# EasyEDA Pro project adc_frontend.epro

# Schematic Schematic1
Assembly Variant: Basic; Board Name: Board1; Create Date: 2026-09-28; Page Name: P1; Project Name: ADC; Schematic Name: Schematic1; Update Date: 2026-09-28; Company: 嘉立创EDA; Page Size: A4; Version: V1.0
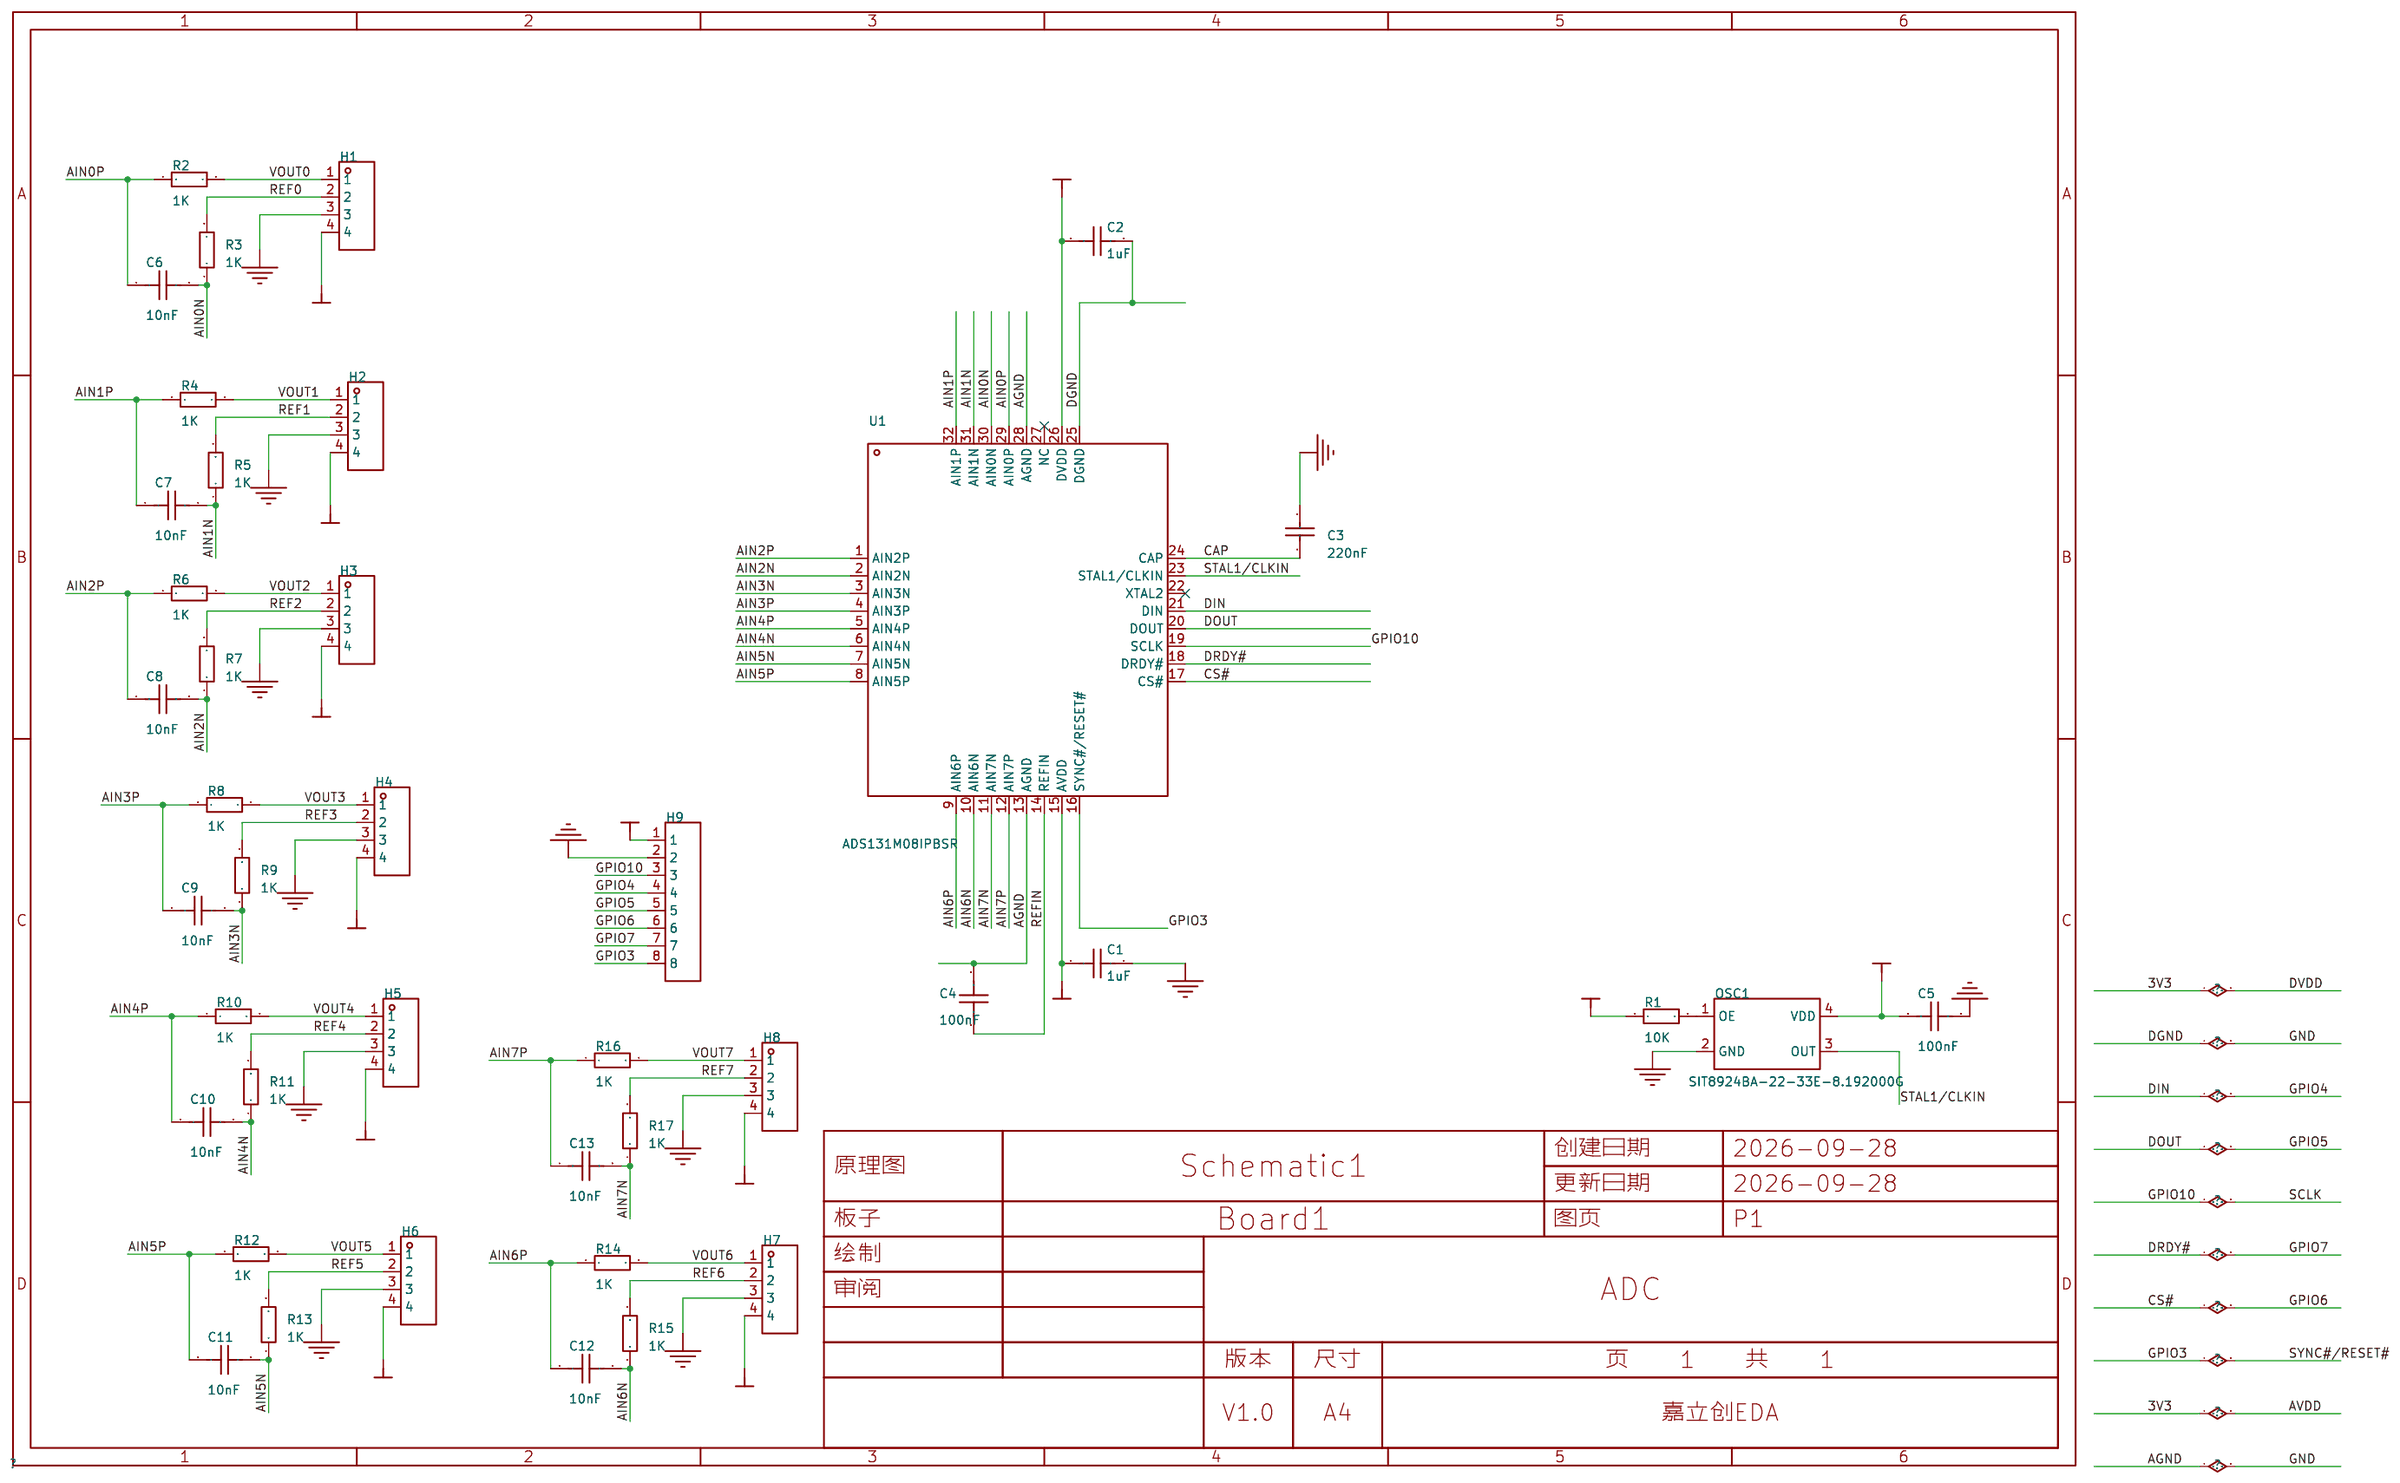
[diagram p0: schematic sheet]

## Parts
C1  1uF  [C0603]
C2  1uF  [C0603]
C3  220nF  [C0603]
C4  100nF  [C0603]
C5  100nF  [C0603]
C6  10nF  [C0603]
C7  10nF  [C0603]
C8  10nF  [C0603]
C9  10nF  [C0603]
C10  10nF  [C0603]
C11  10nF  [C0603]
C12  10nF  [C0603]
C13  10nF  [C0603]
H1  -  [HDR-TH_4P-P2.54-V-F]
H2  -  [HDR-TH_4P-P2.54-V-F]
H3  -  [HDR-TH_4P-P2.54-V-F]
H4  -  [HDR-TH_4P-P2.54-V-F]
H5  -  [HDR-TH_4P-P2.54-V-F]
H6  -  [HDR-TH_4P-P2.54-V-F]
H7  -  [HDR-TH_4P-P2.54-V-F]
H8  -  [HDR-TH_4P-P2.54-V-F]
H9  -  [HDR-TH_8P-P2.54-V-F-1]
OSC1  SIT8924BA-22-33E-8.192000G  [OSC-SMD_4P-L3.2-W2.5-BL-2]
R1  10K  [R0603]
R2  1K  [R0603]
R3  1K  [R0603]
R4  1K  [R0603]
R5  1K  [R0603]
R6  1K  [R0603]
R7  1K  [R0603]
R8  1K  [R0603]
R9  1K  [R0603]
R10  1K  [R0603]
R11  1K  [R0603]
R12  1K  [R0603]
R13  1K  [R0603]
R14  1K  [R0603]
R15  1K  [R0603]
R16  1K  [R0603]
R17  1K  [R0603]
U1  ADS131M08IPBSR  [TQFP-32_L5.0-W5.0-P0.50-LS7.0-TL]

## Library data of the parts
C1 C2 = CC0603KRX7R8BB105: 容值:1uF;精度:±10%;额定电压:25V;温度系数:X7R;; LCSC Part Name: 1uF ±10% 25V; Supplier Part: C106858; Manufacturer: YAGEO(国巨); Supplier Footprint: 0603; JLCPCB Part Class: Extended Part; Datasheet: https://item.szlcsc.com/datasheet/CC0603KRX7R8BB105/108074.html; Supplier: LCSC; Tolerance: ±10%; Voltage Rating: 25V; Temperature Coefficient: X7R
C3 = CL10B224KA8NNNC: 容值:220nF;精度:±10%;额定电压:25V;温度系数:X7R;; LCSC Part Name: 220nF ±10% 25V; Supplier Part: C21120; Manufacturer: SAMSUNG(三星); Supplier Footprint: 0603; JLCPCB Part Class: Basic Part; Datasheet: https://item.szlcsc.com/datasheet/CL10B224KA8NNNC/21832.html; Supplier: LCSC; Tolerance: ±10%; Voltage Rating: 25V; Temperature Coefficient: X7R
C4 C5 = FCC0603B104K500CT: 容值:100nF;精度:±10%;额定电压:50V;温度系数:X7R;; LCSC Part Name: 100nF ±10% 50V; Supplier Part: C5137636; Manufacturer: FOJAN(富捷); Supplier Footprint: 0603; JLCPCB Part Class: 扩展库; Datasheet: https://item.szlcsc.com/datasheet/FCC0603B104K500CT/5747088.html; Supplier: LCSC; Tolerance: ±10%; Voltage Rating: 50V; Temperature Coefficient: X7R
C6-C13 = CAP_0603: Supplier Footprint: 0603
H1-H8 = HDR-F_2.54_1x4P: Supplier Part: C2718488; Supplier Footprint: 插件
H9 = HDR-F_2.54_1x8P: Supplier Part: C27438; Supplier Footprint: 插件
OSC1 = SIT8924BA-22-33E-8.192000G: Supplier Part: C7496633; Manufacturer: SITIME; Supplier Footprint: SMD3225-4P; JLCPCB Part Class: Extended Part; Supplier: LCSC
R1-R17 = Res_0603: Supplier Footprint: 0603
U1 = ADS131M08IPBSR: 分辨率(位):24;采样率:32kHz;工作电压:2.7V~3.6V;接口类型:SPI;; LCSC Part Name: 8通道、同步采样、24位△-∑ ADC; Supplier Part: C2862610; Manufacturer: TI(德州仪器); Supplier Footprint: TQFP-32(5x5); JLCPCB Part Class: Extended Part; Datasheet: https://www.ti.com/cn/lit/ds/symlink/ads131m08.pdf; Supplier: LCSC; Resolution (Bits): 24; Sampling Rate: 32kHz; number of channels: 8; Voltage - Supply: 2.7V~3.6V; Interface: SPI; differential input: 是; Integral non - linearity: 7.5LSB; Operating Temperature: -40℃~+125℃; Signal-to-Noise Ratio: 101dB; Clock/Oscillator: 外置; Clock Frequency: 8.192MHz; Voltage Reference: 内置; Programmable Gain: 支持; ADC architecture: Sigma-Delta; Quiescent Current (Iq): 350nA; Features: 多芯片同步；同步触发；内置数字滤波器；集成调制器；上电复位；输入缓冲器；自动校准；双极性输入

## Nets
3V3: C1.1 C2.1 C5.2 H1.4 H2.4 H3.4 H4.4 H5.4 H6.4 H7.4 H8.4 H9.1 OSC1.4(VDD) R1.1 U1.15(AVDD) U1.26(DVDD)
GND: C1.2 C2.2 C3.1 C4.2 C5.1 H1.3 H2.3 H3.3 H4.3 H5.3 H6.3 H7.3 H8.3 H9.2 OSC1.2(GND) U1.13(AGND) U1.25(DGND) U1.28(AGND)
AIN0N: C6.2 R3.1 U1.30(AIN0N)
AIN0P: C6.1 R2.1 U1.29(AIN0P)
AIN1N: C7.2 R5.1 U1.31(AIN1N)
AIN1P: C7.1 R4.1 U1.32(AIN1P)
AIN2N: C8.2 R7.1 U1.2(AIN2N)
AIN2P: C8.1 R6.1 U1.1(AIN2P)
AIN3N: C9.2 R9.1 U1.3(AIN3N)
AIN3P: C9.1 R8.1 U1.4(AIN3P)
AIN4N: C10.2 R11.1 U1.6(AIN4N)
AIN4P: C10.1 R10.1 U1.5(AIN4P)
AIN5N: C11.2 R13.1 U1.7(AIN5N)
AIN5P: C11.1 R12.1 U1.8(AIN5P)
AIN6N: C12.2 R15.1 U1.10(AIN6N)
AIN6P: C12.1 R14.1 U1.9(AIN6P)
AIN7N: C13.2 R17.1 U1.11(AIN7N)
AIN7P: C13.1 R16.1 U1.12(AIN7P)
CAP: C3.2 U1.24(CAP)
CS#: H9.6 U1.17(CS#)
DIN: H9.4 U1.21(DIN)
DOUT: H9.5 U1.20(DOUT)
DRDY#: H9.7 U1.18(DRDY#)
GPIO3: H9.8 U1.16(SYNC#/RESET#)
GPIO10: H9.3 U1.19(SCLK)
REF0: H1.2 R3.2
REF1: H2.2 R5.2
REF2: H3.2 R7.2
REF3: H4.2 R9.2
REF4: H5.2 R11.2
REF5: H6.2 R13.2
REF6: H7.2 R15.2
REF7: H8.2 R17.2
REFIN: C4.1 U1.14(REFIN)
STAL1/CLKIN: OSC1.3(OUT) U1.23(STAL1/CLKIN)
VOUT0: H1.1 R2.2
VOUT1: H2.1 R4.2
VOUT2: H3.1 R6.2
VOUT3: H4.1 R8.2
VOUT4: H5.1 R10.2
VOUT5: H6.1 R12.2
VOUT6: H7.1 R14.2
VOUT7: H8.1 R16.2
$1N41: OSC1.1(OE) R1.2

Not connected (* = marked no-connect by the designer): U1 22(XTAL2)* 27(NC)*

# Board PCB1
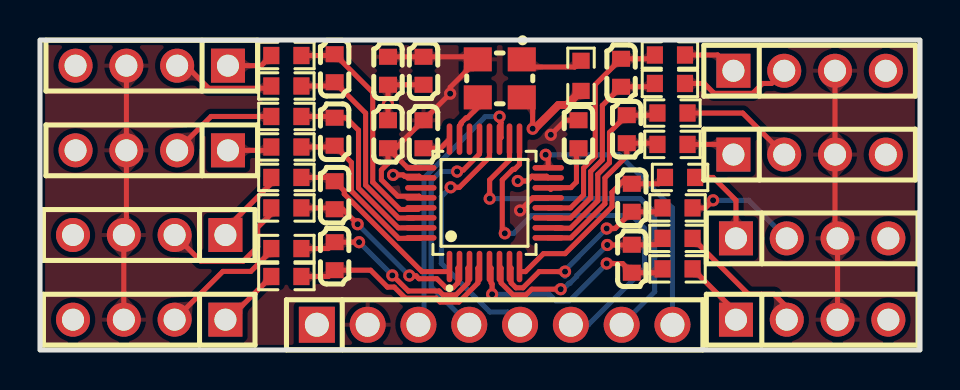
[diagram p1: board, top side]
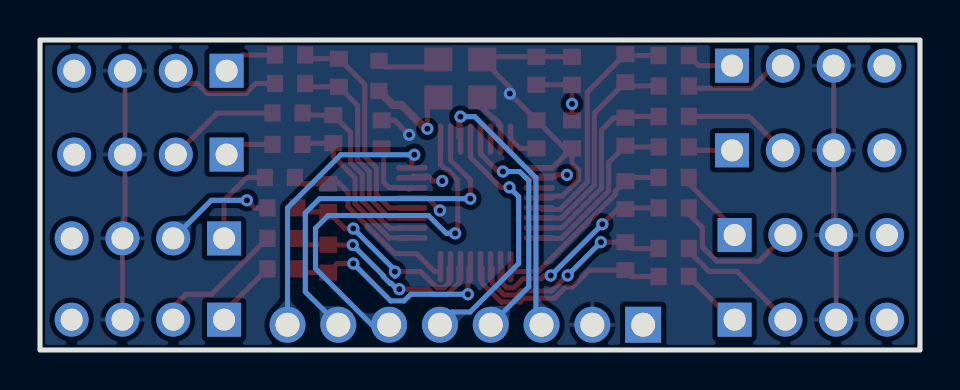
[diagram p2: board, bottom side, seen from below]

Outline 44 x 15.5 mm; copper layers: Top Layer, Inner1, Inner2, Bottom Layer. Coordinates in mm from the lower left corner of the outline.
Outline path: rectangle 0,15.5 44,0
Stack: Top Layer 0.035mm Outer layer thickness 1oz / Dielectric1 0.2104mm 7628 RC49% 8.6mil / Inner1 0.0152mm Inner layer thickness / Dielectric2 1.065mm 1.1mm H/HOZ Copper / Inner2 0.0152mm Inner layer thickness / Dielectric3 0.2104mm 7628 RC49% 8.6mil / Bottom Layer 0.035mm Outer layer thickness 1oz

## Design rules (mm)
spacing copperThickness1oz (default): track to track 0.102, other pairs 0.152 to 0.3
spacing copperThickness2oz: track to track 0.203, other pairs 0.152 to 0.3
track width copperThickness1oz (default): min 0.127, default 0.254, max 2.54
track width copperThickness2oz: min 0.203, default 0.254, max 2.54
differential pair differentialPair (default): width min 0.127, default 0.254, max 2.54; gap min 0.152, default 0.152
net GND uses copperRegion
net 3V3 uses copperRegion

## Placement (name value [footprint] x y rotation side)
C1  1uF  [C0603]  17.4 10.79 270 top
C2  1uF  [C0603]  17.4 13.96 90 top
C3  220nF  [C0603]  19.18 10.79 270 top
C4  100nF  [C0603]  26.92 10.79 90 top
C5  100nF  [C0603]  19.18 13.96 270 top
C6  10nF  [C0603]  14.73 14.09 270 top
C7  10nF  [C0603]  14.73 10.91 90 top
C8  10nF  [C0603]  14.73 7.74 270 top
C9  10nF  [C0603]  14.73 4.69 90 top
C10  10nF  [C0603]  29.59 4.56 90 top
C11  10nF  [C0603]  29.59 7.61 270 top
C12  10nF  [C0603]  29.34 11.04 90 top
C13  10nF  [C0603]  29.05 13.86 270 top
H1  -  [HDR-TH_4P-P2.54-V-F]  5.59 14.22 180 top
H2  -  [HDR-TH_4P-P2.54-V-F]  5.59 9.98 180 top
H3  -  [HDR-TH_4P-P2.54-V-F]  5.46 5.75 180 top
H4  -  [HDR-TH_4P-P2.54-V-F]  5.46 1.52 180 top
H5  -  [HDR-TH_4P-P2.54-V-F]  38.61 1.52 0 top
H6  -  [HDR-TH_4P-P2.54-V-F]  38.61 5.58 0 top
H7  -  [HDR-TH_4P-P2.54-V-F]  38.48 9.77 0 top
H8  -  [HDR-TH_4P-P2.54-V-F]  38.48 13.96 0 top
H9  -  [HDR-TH_8P-P2.54-V-F-1]  22.73 1.26 0 top
OSC1  SIT8924BA-22-33E-8.192000G  [OSC-SMD_4P-L3.2-W2.5-BL-2]  22.99 13.58 180 top
R1  10K  [R0603]  27.05 13.71 90 top
R2  1K  [R0603]  12.32 14.72 180 top
R3  1K  [R0603]  12.32 13.2 180 top
R4  1K  [R0603]  12.32 10.15 180 top
R5  1K  [R0603]  12.32 11.68 180 top
R6  1K  [R0603]  12.32 8.63 180 top
R7  1K  [R0603]  12.32 7.1 180 top
R8  1K  [R0603]  12.32 3.68 180 top
R9  1K  [R0603]  12.32 5.07 180 top
R10  1K  [R0603]  31.88 4.06 0 top
R11  1K  [R0603]  31.88 5.58 0 top
R12  1K  [R0603]  32 8.63 0 top
R13  1K  [R0603]  31.88 7.1 0 top
R14  1K  [R0603]  31.62 10.28 0 top
R15  1K  [R0603]  31.62 11.85 0 top
R16  1K  [R0603]  31.5 14.75 0 top
R17  1K  [R0603]  31.5 13.33 0 top
U1  ADS131M08IPBSR  [TQFP-32_L5.0-W5.0-P0.50-LS7.0-TL]  22.22 7.36 90 top

## Footprints (pads in the part's own frame, mm; a bottom-side part is the same pattern mirrored in y, then rotated)
C0603
  rect 0.8x0.9 smd: 1(-0.7,0) 2(0.7,0)
HDR-TH_4P-P2.54-V-F
  rect 1.7x1.7 hole 1.1: 1(-3.81,0)
  round 1.7 hole 1.1: 2(-1.27,0) 3(1.27,0) 4(3.81,0)
HDR-TH_8P-P2.54-V-F-1
  rect 1.8x1.8 hole 1.2: 1(-8.89,0)
  round 1.8 hole 1.2: 2(-6.35,0) 3(-3.81,0) 4(-1.27,0) 5(1.27,0) 6(3.81,0) 7(6.35,0) 8(8.89,0)
OSC-SMD_4P-L3.2-W2.5-BL-2
  rect 1.4x1.2 smd: 1(-1.1,-0.95) 2(1.1,-0.95) 3(1.1,0.95) 4(-1.1,0.95)
R0603
  rect 0.806x0.864 smd: 1(-0.753,0) 2(0.753,0)
TQFP-32_L5.0-W5.0-P0.50-LS7.0-TL
  oval 1.57x0.28 smd: 1(-3.185,1.75) 2(-3.185,1.25) 3(-3.185,0.75) 4(-3.185,0.25) 5(-3.185,-0.25) 6(-3.185,-0.75) 7(-3.185,-1.25) 8(-3.185,-1.75) 17(3.185,-1.75) 18(3.185,-1.25) 19(3.185,-0.75) 20(3.185,-0.25) 21(3.185,0.25) 22(3.185,0.75) 23(3.185,1.25) 24(3.185,1.75)
  oval 0.28x1.57 smd: 9(-1.75,-3.185) 10(-1.25,-3.185) 11(-0.75,-3.185) 12(-0.25,-3.185) 13(0.25,-3.185) 14(0.75,-3.185) 15(1.25,-3.185) 16(1.75,-3.185) 25(1.75,3.185) 26(1.25,3.185) 27(0.75,3.185) 28(0.25,3.185) 29(-0.25,3.185) 30(-0.75,3.185) 31(-1.25,3.185) 32(-1.75,3.185)

## Nets
As in the schematic.

Pads without a net: U1 22 27

## Via types
v1: diameter 0.61, hole 0.305, Top Layer to Bottom Layer, 24 vias

## Routing (per net, layer and track width the routed paths; a pad name or vN(x,y) marks a point on that pad's centre or on a via; arc(x,y) is an arc through that point)
3V3: length 105.1
  Top Layer w0.254: C5.2 C2.1 v1(17.4,12.3) C1.1 ; v1(17.65,8.76) 18.16,8.76 18.22,8.69 18.96,8.69 U1.26 ; v1(24.63,11.06) 24.63,12.09 OSC1.4 ; U1.15 25.33,8.69 24.59,8.69 24.35,8.45 v1(23.89,8.45)
  Top Layer w0.4: R1.1 26.35,12.25 25.92,12.25 24.73,11.06 v1(24.63,11.06)
  Inner2 w0.4: H8.4 41.78,13.96 40,12.18 25.63,12.18 24.63,11.19 ; H4.4 H3.4 1.78,5.88 H2.4 H1.4 2.62,14.22 3.82,13.01 10.39,13.01 11.6,14.22 22.35,14.22 24.63,11.94 v1(24.63,11.06) 24.26,10.69 24.26,8.82 v1(23.89,8.45) 23.32,8.45 22.19,9.58 20.12,9.58 v1(17.4,12.3) 17.4,9.01 v1(17.65,8.76) 17.65,5.07 H9.1
  Inner2 w0.5: 42.42,1.52 42.42,5.58 42.29,5.71 H7.4 H8.4
GND: length 114.2
  Top Layer w0.254: 39.88,1.52 39.88,5.58 39.75,5.71 H7.3 H8.3 ; U1.25 18.38,9.11 C1.2 ; v1(25.54,10.76) 26.27,11.49 C4.2 ; C2.2 C5.1 21.5,14.66 22.01,14.15 21.52,14.15 20.51,13.13 v1(20.51,12.82) C3.1 17.78,10.09 C1.2 ; C1.2 17.4,9.33 17.07,9 17.07,8.51 17.89,7.69 18.96,7.69 U1.28 ; v1(24,6.98) 24.63,7.61 U1.13 ; H1.3 H2.3 4.32,5.88 H3.3 H4.3
  Inner1 w0.4: v1(25.54,10.76) 26.08,11.3 37.34,11.3 39.75,13.71 H8.3 ; 23.98,6.95 23.52,6.49 19.61,6.49 19.15,6.95 ; H9.2 16.38,4.18 19.15,6.95 ; H7.3 36.76,6.78 24.2,6.78 v1(24,6.98) 22.99,7.99 22.99,10.34 v1(20.51,12.82) ; 19.15,6.95 8.19,6.95 5.16,9.98 H2.3
AIN0N: length 10.6
  Top Layer w0.254: 18.67,6.6 17.93,6.6 16.28,8.25 16.28,11.84 C6.2 14.54,13.2 R3.1
AIN0P: length 11.7
  Top Layer w0.254: R2.1 14.67,14.72 C6.1 16.64,12.88 16.64,8.39 18,7.03 18.91,7.03
AIN1N: length 10
  Top Layer w0.254: R5.1 14.67,11.68 C7.2 15.3,11.61 15.92,10.99 15.92,8.1 17.91,6.11 U1.31
AIN1P: length 8.8
  Top Layer w0.254: R4.1 14.67,10.15 C7.1 15.57,9.38 15.57,7.95 17.94,5.58 19.01,5.58 U1.32
AIN2N: length 10.4
  Top Layer w0.254: R7.1 14.67,7.1 C8.2 15.13,7.04 v1(15.88,6.29) ; 18.45,3.71 18.8,3.71 18.95,3.56 19.85,3.56 20.3,3.11 20.65,3.11 20.89,3.35 20.89,4.09 U1.2
  Bottom Layer w0.254: v1(15.88,6.29) 18.45,3.72 18.45,3.71
  vias: v1(18.47,3.73)
AIN2P: length 9.3
  Top Layer w0.254: 20.35,3.92 19.1,3.92 15.21,7.8 15.21,7.96 C8.1 14.54,8.63 R6.1
AIN3N: length 10.6
  Top Layer w0.254: v1(15.95,5.39) C9.2 14.41,5.07 R9.1 ; U1.3 21.39,4.09 21.39,3.35 20.8,2.75 20.15,2.75 19.96,2.95 18.41,2.95 17.63,3.73 v1(17.62,3.73)
  Bottom Layer w0.254: v1(15.95,5.39) v1(17.62,3.73)
AIN3P: length 10.9
  Top Layer w0.254: U1.4 21.89,4.09 21.89,3.35 20.94,2.4 20.01,2.4 19.81,2.59 18.27,2.59 17.72,3.15 17.37,3.15 16.53,3.99 C9.1 14.42,3.68 R8.1
AIN4N: length 10.4
  Top Layer w0.254: U1.6 23.06,4.09 23.06,3.35 23.65,2.75 24.3,2.75 24.58,3.04 v1(26.03,3.04) ; v1(28.36,5.25) 29.58,5.25 C10.2 30.81,5.26 R11.1
  Bottom Layer w0.254: v1(28.36,5.25) 26.84,3.72 26.84,3.68 26.49,3.34 26.45,3.34 26.15,3.04 v1(26.03,3.04)
AIN4P: length 11.1
  Top Layer w0.254: R10.1 30.93,3.86 C10.1 29.13,4.32 v1(28.34,4.32) ; U1.5 22.56,4.09 22.56,3.35 22.61,3.3 v1(22.61,2.79)
  Bottom Layer w0.254: v1(28.34,4.32) 26.47,2.46 25.79,2.46 25.46,2.79 v1(22.61,2.79)
AIN5N: length 10.5
  Top Layer w0.254: v1(28.33,6.07) 28.75,6.07 C11.2 30.93,6.91 R13.1 ; U1.7 23.56,4.09 23.56,3.35 23.8,3.11 24.15,3.11 24.96,3.92 v1(26.25,3.92)
  Bottom Layer w0.254: 26.25,3.68 26.19,3.74 26.19,3.93 v1(28.33,6.07)
AIN5P: length 9.6
  Top Layer w0.254: R12.1 30.93,8.31 C11.1 ; 29.59,8.57 29.28,8.57 28.6,7.89 28.6,7.17 26.25,4.82 25.17,4.82 24.27,3.92 24.1,3.92
AIN6N: length 9.1
  Top Layer w0.254: 25.77,6.09 26.52,6.09 27.89,7.46 27.89,8.78 28.47,9.36 28.47,10.88 C12.2 30.76,11.74 R15.1
AIN6P: length 8.6
  Top Layer w0.254: R14.1 30.81,10.34 C12.1 29.34,9.7 28.25,8.6 28.25,7.32 26.54,5.61 U1.9
AIN7N: length 10.5
  Top Layer w0.254: U1.11 25.42,6.6 26.52,6.6 27.53,7.61 27.53,8.93 28.12,9.51 28.12,12.23 C13.2 30.58,13.16 R17.1
AIN7P: length 11.4
  Top Layer w0.254: U1.12 25.41,7.1 26.52,7.1 27.18,7.76 27.18,9.1 27.76,9.68 27.76,13.27 C13.1 30.55,14.56 R16.1
CAP: length 1.5
  Top Layer w0.254: C3.2 20.02,10.09 U1.24
CS#: length 19.6
  Top Layer w0.254: U1.17 23.97,9.28 23.73,9.03 23.65,9.03 23.11,8.5 23.11,5.96 v1(23.24,5.83)
  Bottom Layer w0.254: H9.6 27.42,1.26 30.23,4.07 30.23,6.09 29.59,6.72 24.57,6.72 23.69,5.83 v1(23.24,5.83)
DIN: length 11.7
  Top Layer w0.254: v1(20.85,8.92) 20.93,9 21.17,9 21.97,9.81 U1.21
  Bottom Layer w0.254: H9.4 19.56,3.17 19.56,8.46 20.02,8.92 v1(20.85,8.92)
DOUT: length 12.7
  Top Layer w0.254: v1(20.53,8.13) 20.97,8.13 22.47,9.64 U1.20
  Bottom Layer w0.254: v1(20.53,8.13) 20.07,7.67 20.07,4.33 22.5,1.9 23.37,1.9 H9.5
DRDY#: length 18.2
  Top Layer w0.254: v1(22.48,7.57) 22.48,8.51 23.47,9.5 U1.18
  Bottom Layer w0.254: H9.7 30.73,2.91 30.73,6.85 30.02,7.57 v1(22.48,7.57)
GPIO3: length 14
  Top Layer w0.254: v1(25.28,9.76) 25.41,9.63 U1.16
  Bottom Layer w0.254: H9.8 31.62,7.1 28.97,9.76 v1(25.28,9.76)
GPIO10: length 13.7
  Top Layer w0.254: v1(22.98,11.67) 22.98,11.44 23.06,11.36 23.06,10.62 U1.19
  Bottom Layer w0.254: H9.3 19.2,1.54 19.2,8.61 22.26,11.67 v1(22.98,11.67)
REF0: length 5.2
  Top Layer w0.254: H1.2 7.3,14.22 8.43,13.09 11.45,13.09 R3.2
REF1: length 5.4
  Top Layer w0.254: R5.2 8.55,11.68 H2.2
REF2: length 7.2
  Top Layer w0.254: H3.2 8.04,4.44 10.16,4.44 10.88,5.16 10.88,6.13 11.57,6.81 R7.2
REF3: length 6.4
  Top Layer w0.254: R9.2 11.57,4.95 10.54,3.93 9.14,3.93 H4.2
REF4: length 6.8
  Top Layer w0.254: H5.2 37.34,2.15 36.7,2.79 35.42,2.79 R11.2
REF5: length 5.7
  Top Layer w0.254: v1(33.66,7.48) 33.27,7.1 R13.2
  Bottom Layer w0.254: H6.2 35.43,7.48 v1(33.66,7.48)
REF6: length 5.7
  Top Layer w0.254: H7.2 35.13,11.85 R15.2
REF7: length 5.6
  Top Layer w0.254: H8.2 36.58,13.33 36.13,13.33 35.64,12.83 33.71,12.83 33.21,13.33 R17.2
REFIN: length 2.8
  Top Layer w0.254: 25.54,8.03 25.54,8.12 26.54,8.12 26.82,8.4 26.82,9.71 26.8,9.71
STAL1/CLKIN: length 2.2
  Top Layer w0.254: U1.23 20.97,11.21 21.06,11.29 21.06,11.36 21.3,11.61 21.37,11.61 22.01,12.25
VOUT0: length 2.4
  Top Layer w0.254: R2.2 11.06,14.22 H1.1
VOUT1: length 2.2
  Top Layer w0.254: H2.1 11.4,9.98 R4.2
VOUT2: length 3.8
  Top Layer w0.254: H3.1 9.65,6.13 9.65,6.42 11.57,8.33 R6.2
VOUT3: length 3.2
  Top Layer w0.254: H4.1 9.41,1.52 R8.2
VOUT4: length 3.4
  Top Layer w0.254: R10.2 34.8,1.89 H5.1
VOUT5: length 4.4
  Top Layer w0.254: H6.1 34.8,7.48 33.66,8.63 R12.2
VOUT6: length 2.5
  Top Layer w0.254: R14.2 34.16,10.28 H7.1
VOUT7: length 2.7
  Top Layer w0.254: R16.2 33.88,14.75 H8.1
$1N41: length 3
  Top Layer w0.254: R1.2 26.74,14.15 24.21,14.15

## Copper pours and planes (outline as drawn; the poured copper is in the pictures)
3V3 on Inner2: -1.65,17.9 45.59,17.9 45.59,-1.28 -1.65,-1.28
GND on Top Layer: -3.56,16.76 44.83,16.76 44.83,-1.53 -3.56,-1.53
GND on Bottom Layer: -1.91,19.17 45.59,19.17 45.59,-3.06 -1.91,-3.06
GND on Inner1: -1.52,17.39 45.85,17.39 45.85,-4.2 -1.52,-4.2

Small or netless copper shapes (teardrops, artwork), in the pictures only: 157 on Top Layer, 24 on Bottom Layer, 10 on Inner1, 23 on Inner2
